# Altium schematic sheet 09 - CONNECTOR_CSKB.SchDoc
size A4; SheetNumber: 7; SheetTotal: 7
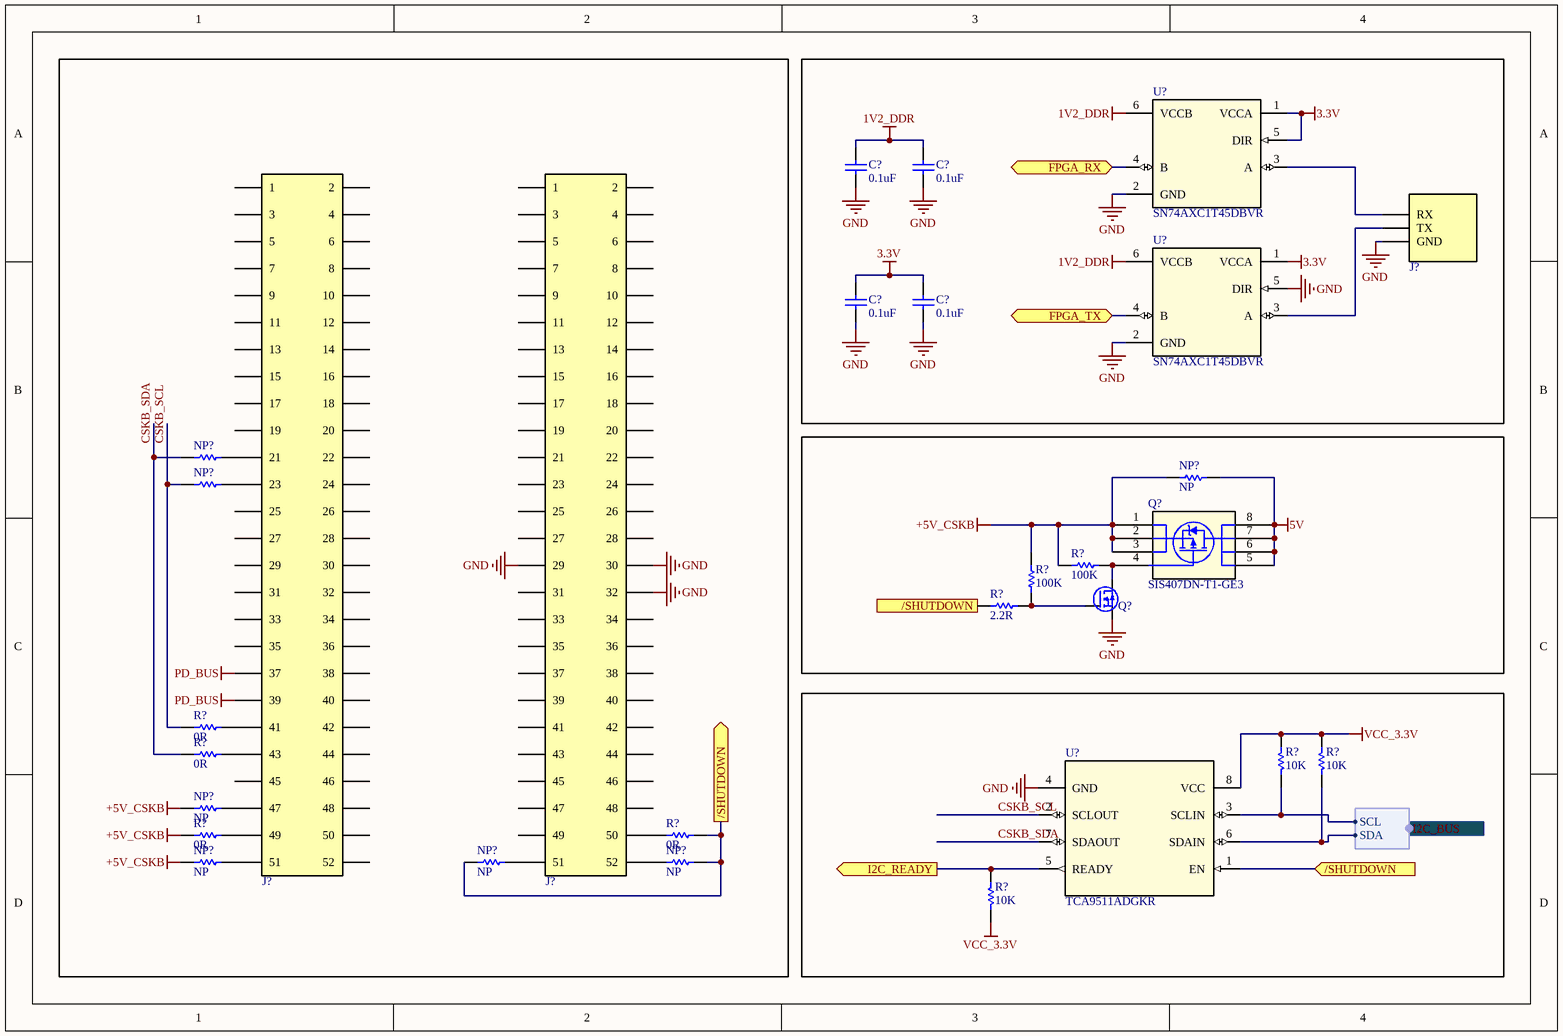
[diagram p0: 09 - CONNECTOR_CSKB.SchDoc]

## Parts
(Parts that share a designator on the sheet are numbered #1, #2 ... from top to bottom, then left to right.)
C?#1  value 0.1uF  [0402-C-R]  (hidden comment: GRM155R61E104KA87D)
C?#2  value 0.1uF  [0402-C-R]  (hidden comment: GRM155R61E104KA87D)
C?#3  value 0.1uF  [0402-C-R]  (hidden comment: GRM155R61E104KA87D)
C?#4  value 0.1uF  [0402-C-R]  (hidden comment: GRM155R61E104KA87D)
J?#1  CONN PTH 3PIN  [CONNECTOR BATTERY]  (value not drawn)
J?#2  ESQ-126-39-G-D  [SAMTEC_ESQ-126-39-G-D]  (value not drawn)
J?#3  ESQ-126-39-G-D  [SAMTEC_ESQ-126-39-G-D]  (value not drawn)
NP?#1  NP  [0402-R-NP]  (value not drawn)
NP?#2  NP  [0402-R-NP]
NP?#3  NP  [0402-R-NP]  (value not drawn)
NP?#4  NP  [0402-R-NP]
NP?#5  NP  [0402-R-NP]
NP?#6  NP  [0402-R-NP]
NP?#7  NP  [0402-R-NP]
Q?#1  SIS407DN-T1-GE3  [SIS413DN-T1-GE3_VIS]
Q?#2  IRF8010PBF  [SC70-6L_VIS]  (value not drawn)
R?#1  value 100K  [0402-R-R]  (hidden comment: RMCF0402FT100K)
R?#2  value 2.2R  [0402-R-R]  (hidden comment: RC0402FR-072R2L)
R?#3  value 100K  [0402-R-R]  (hidden comment: RMCF0402FT100K)
R?#4  value 0R  [0402-R-R]  (hidden comment: RMCF0402ZT0R00)
R?#5  value 0R  [0402-R-R]  (hidden comment: RMCF0402ZT0R00)
R?#6  value 10K  [0402-R-R]  (hidden comment: RMCF0402FT10K0)
R?#7  value 10K  [0402-R-R]  (hidden comment: RMCF0402FT10K0)
R?#8  value 0R  [0402-R-R]  (hidden comment: RMCF0402ZT0R00)
R?#9  value 0R  [0402-R-R]  (hidden comment: RMCF0402ZT0R00)
R?#10  value 10K  [0402-R-R]  (hidden comment: RMCF0402FT10K0)
U?#1  SN74AXC1T45DBVR  [SN74AXC1T45DBVR]
U?#2  SN74AXC1T45DBVR  [SN74AXC1T45DBVR]
U?#3  TCA9511ADGKR  [DGK0008A_L]

## Ports
/SHUTDOWN (in), /SHUTDOWN (out), FPGA_RX (bidir), FPGA_TX (bidir), I2C_BUS (harness I2C), I2C_READY (out)

## Harnesses
I2C: SCL, SDA

## Nets
1V2_DDR: C?#1.2 C?#2.2 U?#1.6(VCCB) U?#2.6(VCCB)
3.3V: C?#3.2 C?#4.2 U?#1.1(VCCA) U?#1.5(DIR) U?#2.1(VCCA)
5V: NP?#2.2 Q?#1.5(D) Q?#1.6(D) Q?#1.7(D) Q?#1.8(D)
+5V_CSKB: NP?#2.1 NP?#4.1 NP?#5.1 Q?#1.1(S) Q?#1.2(S) Q?#1.3(S) R?#1.2 R?#3.2 R?#8.1
GND: C?#1.1 C?#2.1 C?#3.1 C?#4.1 J?#1.1(GND) J?#3.29 J?#3.30 J?#3.32 Q?#2.4,7(S) U?#1.2(GND) U?#2.2(GND) U?#2.5(DIR) U?#3.4(GND)
PD_BUS: J?#2.37 J?#2.39
VCC_3.3V: R?#6.2 R?#7.2 R?#10.1 U?#3.8(VCC)
/SHUTDOWN: NP?#6.1 NP?#7.2 R?#2.1 R?#9.2 U?#3.1(EN) ; port /SHUTDOWN
CSKB_SCL: NP?#3.1 R?#4.1 U?#3.2(SCLOUT)
CSKB_SDA: NP?#1.1 R?#5.1 U?#3.7(SDAOUT)
FPGA_RX: U?#1.4(B) ; port FPGA_RX
FPGA_TX: U?#2.4(B) ; port FPGA_TX
I2C_READY: R?#10.2 U?#3.5(READY) ; port I2C_READY
NetJ?#1_2: J?#1.2(TX) U?#2.3(A)
NetJ?#1_3: J?#1.3(RX) U?#1.3(A)
NetJ?#2_21: J?#2.21 NP?#1.2
NetJ?#2_23: J?#2.23 NP?#3.2
NetJ?#2_41: J?#2.41 R?#4.2
NetJ?#2_43: J?#2.43 R?#5.2
NetJ?#2_47: J?#2.47 NP?#4.2
NetJ?#2_49: J?#2.49 R?#8.2
NetJ?#2_51: J?#2.51 NP?#5.2
NetJ?#3_50: J?#3.50 R?#9.1
NetJ?#3_51: J?#3.51 NP?#6.2
NetJ?#3_52: J?#3.52 NP?#7.1
NetQ?#1_4: Q?#1.4(G) Q?#2.1,2,5,6(D) R?#1.1
NetQ?#2_3: Q?#2.3(G) R?#2.2 R?#3.1
NetR?#6_1: R?#6.1 U?#3.3(SCLIN) ; port I2C_BUS.SCL
NetR?#7_1: R?#7.1 U?#3.6(SDAIN) ; port I2C_BUS.SDA

Not connected (* = marked no-connect by the designer): J?#2 01(1) 02(2) 03(3) 04(4) 05(5) 06(6) 07(7) 08(8) 09(9) 10 11 12 13 14 15 16 17 18 19 20 22 24 25 26 27 28 29 30 31 32 33 34 35 36 38 40 42 44 45 46 48 50 52; J?#3 01(1) 02(2) 03(3) 04(4) 05(5) 06(6) 07(7) 08(8) 09(9) 10 11 12 13 14 15 16 17 18 19 20 21 22 23 24 25 26 27 28 31 33 34 35 36 37 38 39 40 41 42 43 44 45 46 47 48 49

## Library data of the parts
C?#1-C?#4 = CAP CER 0.1UF 25V X5R 0402: 0.1 µF ±10% 25V Ceramic Capacitor X5R 0402 (1005 Metric); SIZE: 0402; PN: GRM155R61E104KA87D; VOLTAGE: 25V; TOLERANCE: 10%
J?#2 J?#3 = CONN SOCKET 52POS 0.1 GOLD PCB: CONN SOCKET 52POS 0.1 GOLD PCB PN: ESQ-126-39-G-D; MF: Samtec; Package: None; PN: ESQ-126-39-G-D; Value: *; Availability: Unavailable; Price: None; SnapEDA_Link: https://www.snapeda.com/parts/ESQ-126-39-G-D/Samtec%20Inc./view-part/490181/?ref=snap
NP?#1-NP?#7 = RES SMD 0402 NP: PACK: 0402; VALUE: NP
Q?#1 = MOSFET P-CH 20V 9.5mOhm  25A: MOSFET P-CH 20V 25A 9.5mOhm PPAK1212-8 PN: SIS407DN-T1-GE3; Mfr_Name: Vishay; RefDes: RefDes; Type: Type; PN: SIS407DN-T1-GE3
Q?#2 = MOSFET N-CH 8V 12A PPAK SC70-6: MOSFET N-CH 8V 12A PPAK SC70-6 PN: SIA436DJ-T1-GE3; ID: 5714; CÓDIGO: 1003180105; PN: SIA436DJ-T1-GE3
R?#1 R?#3 = RES SMD 0402 100K 0.063W ±1%: RES SMD GERAL FILM 100K 0.063W ±1% 0402 7" TAPE PN: RMCF0402FT100K; PACK: 0402; POWER: 0.063W; TOLERANCE: 1%; PN: RMCF0402FT100K
R?#2 = RES SMD 0402 2.2R 0.063W ±1%: RES SMD GERAL FILM 2.2R 0.063W ±1% 0402 7" TAPE PN: RC0402FR-072R2L; PACK: 0402; POWER: 0.063W; TOLERANCE: 1%; PN: RC0402FR-072R2L
R?#4 R?#5 R?#8 R?#9 = RES SMD 0402 0R 0.063W ±1%: RES SMD GERAL FILM 0R 0.063W ±1% 0402 7" TAPE PN: RMCF0402ZT0R00 STACKPOLE; PACK: 0402; TOLERANCE: 1%; POWER: 0.063W; PN: RMCF0402ZT0R00
R?#6 R?#7 R?#10 = RES SMD 0402 10K 0.063W ±1%: RES SMD GERAL FILM 10K 0.063W ±1% 0402 7" TAPE PN: RMCF0402FT10K0 STACKPOLE; PACK: 0402; POWER: 0.063W; TOLERANCE: 1%; PN: RMCF0402FT10K0
U?#1 U?#2 = IC TRANSLATOR BIDIR SOT23-6: Nível de tensão Tradutor Bidirecional 1 Circuito 1 Canal 500Mbps SOT-23-6. PN: SN74AXC1T45DBVR; MF: Texas Instruments; SnapEDA_Link: https://www.snapeda.com/parts/SN74AXC1T45DBVR/Texas+Instruments/view-part/?ref=snap; Availability: In Stock; MP: SN74AXC1T45DBVR; Price: None; Purchase-URL: https://pricing.snapeda.com/search/part/SN74AXC1T45DBVR/?ref=eda; Check_prices: https://www.snapeda.com/parts/SN74AXC1T45DBVR/Texas+Instruments/view-part/?ref=eda; Package: SOT-23-6 Texas Instruments; Parameter 1: *; Value: *; PN: SN74AXC1T45DBVR
U?#3 = IC BUFFET I2C 1 CHANNEL 8-VSSOP: Buffer, Accelerator 1 Channel 8-VSSOP PN: TCA9511ADGKR; Manufacturer_Name: Texas Instruments; CompType: IC; TYPE: TYPE; RefDes: RefDes; Copyright: Copyright (C) 2025 Ultra Librarian. All rights reserved.; Manufacturer_Part_Number: TCA9511ADGKR; Datasheet: https://www.ti.com/lit/gpn/tca9511a; PN: TCA9511ADGKR; PackageReference: DGK0008A; MountType: SMT; Manufacturer: Texas Instruments